# Altium project Ezlo_Voice_Assistant_Node.PrjPcb (part 1 of 2)
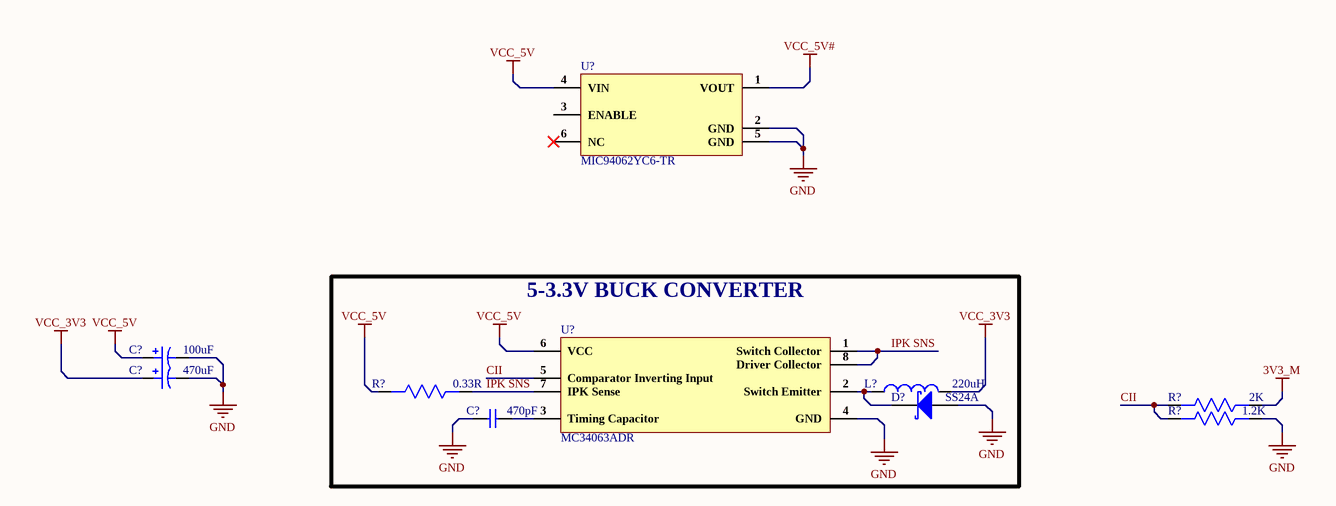
[diagram p0: Power_Section.SchDoc]
9 sheets, 98 parts. Net scope: flat (ports and power ports of the same name join across sheets).
Sheets:
  Top_Sheet.SchDoc
  Power_Section.SchDoc
  Controller_Section.SchDoc
  ADC_Section.SchDoc
  Memory_Section.SchDoc
  Mic_Section.SchDoc
  DAC_Section.SchDoc
  Amplifier_Section.SchDoc
  DSP_Section.SchDoc

## Sheet Top_Sheet.SchDoc
size A4; SheetNumber: 1; SheetTotal: 2

### Notes on the sheet
- 1
- Huzaifa Ali

## Sheet Power_Section.SchDoc
size A4; SheetNumber: 8; SheetTotal: 8

### Parts
(Parts that share a designator on the sheet are numbered #1, #2 ... from top to bottom, then left to right.)
C?#1  100uF  [VKMB1001E101MV]
C?#2  470uF  [VT1H471MI135000CE0]
C?#3  470pF  [Cap 0603]
D?#1  SS24A  [SMA]
L?#1  220uH  [SLF12575T-221M1R3-PF]
R?#1  0.33R  [Res0603]
R?#2  2K  [Res0603]
R?#3  1.2K  [Res0603]
U?#1  MIC94062YC6-TR  [SC-70-6]
U?#2  MC34063ADR  [SOIC-8]

### Blocks framed on the sheet
5-3.3V BUCK CONVERTER: C?#3 D?#1 L?#1 R?#1 U?#2

### Nets
3V3_M: R?#2.1
GND: C?#1.2 C?#2.2 C?#3.1 D?#1.2(A) R?#3.1 U?#1.2(GND) U?#1.5(GND) U?#2.4(GND)
VCC_3V3: C?#2.1 L?#1.2
VCC_5V: C?#1.1 R?#1.2 U?#1.4(VIN) U?#2.6(VCC)
VCC_5V#: U?#1.1(VOUT)
CII: R?#2.2 R?#3.2 U?#2.5(Comparator_Inverting_Input)
IPK SNS: R?#1.1 U?#2.1(Switch_Collector) U?#2.7(IPK_Sense) U?#2.8(Driver_Collector)
NetC?#3_2: C?#3.2 U?#2.3(Timing_Capacitor)
NetD?#1_1: D?#1.1(K) L?#1.1 U?#2.2(Switch_Emitter)

Not connected (* = marked no-connect by the designer): U?#1 3(ENABLE) 6(NC)*

### Notes on the sheet
- 1
- Huzaifa Ali

### Library data of the parts
C?#1 = VKMB1001E101MV: 25V 5mm 10mm 100uF 100kHz SMD,5x10mm Aluminum Electrolytic Cap- SMD ROHS; Manufacturer: Ymin; Manufacturer Part No: VKMB1001E101MV; Value: 100uF; Voltage: 25V; ComponentLink1Description: LCSC; ComponentLink1URL: https://lcsc.com/product-detail/Aluminum-Electrolytic-Capacitors-SMD_Ymin-VKMB1001E101MV_C487322.html
C?#2 = VT1H471MI135000CE0: 470uF ±20% 50V 12.5mm 13.5mm 1000hrs 105℃ -40℃~+105℃ SMD,12.5x13.5mm Aluminum Electrolytic Capacitors - SMD RoHS; Manufacturer: Changzhou Huawei Elec; Package: SMD,12.5x13.5mm; Capacitance: 470uF; Tolerance: ±20%; Rated Voltage: 50V; φD: 12.5mm; L: 13.5mm; Lifetime @ Temp: 1000hrs 105℃; Operating Temperature: -40℃~+105℃
C?#3 = CC0603KRX7R9BB471: CAP CER 470pF 10% X7R 50V 0603 SMD; Manufacturer: Yageo; Dielectric Material: Ceramic; Insulation Resistance: 10GR; Dissipation Factor: 2.5%; Supplier 1: Digi-Key; Manufacturer Part Number: CC0603KRX7R9BB471; RoHS: Yes; Category: Ceramic Capacitors; Stock 1: 2173; Pricing 1: 1=0.10000, 10=0.04500, 50=0.02460, 100=0.02010, 500=0.01432, 1000=0.01125 (USD); Mount: Surface Mount; Case/Package: 0603; Number of Pins: 2; Case Code (Imperial): 0603; Case Code (Metric): 1608; Min Operating Temperature: -55°C; Max Operating Temperature: 125°C; Capacitance: 470pF; Tolerance: 10%; Dielectric: X7R; Series: CC; Voltage Rating: 50V; Voltage Rating (DC): 50V; Packaging: Tape and Reel; Package Quantity: 1; Termination: SMD/SMT; Resistor Type: Ceramic; Length: 1.6mm; Width: 0.8mm; Height: 0.8mm; Depth: 0.8mm; Thickness: 0.035inch; Radiation Hardening: No; RoHS Compliant: Yes; REACH SVHC: No SVHC; Lead Free: Lead Free; Halogen Free: Halogen Free; ComponentLink1URL: https://datasheet.ciiva.com/5425/upy-gphc-x7r-6-3v-to-50v-8-12304-5425461.pdf?src-supplier=Mouser; ComponentLink1Description: https://datasheet.ciiva.com/5425/upy-gphc-x7r-6-3v-to-50v-8-12304-5425461.pdf?src-supplier=Mouser; ComponentLink2URL: https://datasheet.ciiva.com/144/mlccorderingcode-144439.pdf?src-supplier=Digi-Key; ComponentLink2Description: https://datasheet.ciiva.com/144/mlccorderingcode-144439.pdf?src-supplier=Digi-Key; ComponentLink3URL: https://datasheet.ciiva.com/144/mlccorderingcode-144440.pdf?src-supplier=Digi-Key; ComponentLink3Description: https://datasheet.ciiva.com/144/mlccorderingcode-144440.pdf?src-supplier=Digi-Key; ComponentLink4URL: https://datasheet.ciiva.com/11587/upy-gphc-x7r-6-3v-to-50v-8-11587224.pdf?src-supplier=Avnet; ComponentLink4Description: https://datasheet.ciiva.com/11587/upy-gphc-x7r-6-3v-to-50v-8-11587224.pdf?src-supplier=Avnet; ComponentLink5URL: https://datasheet.ciiva.com/144/mlccorderingcode-144441.pdf?src-supplier=Digi-Key; ComponentLink5Description: https://datasheet.ciiva.com/144/mlccorderingcode-144441.pdf?src-supplier=Digi-Key; ComponentLink6URL: https://datasheet.ciiva.com/16623/upy-gphc-x7r-6-3v-to-50v-8-16623897.pdf?src-supplier=Avnet+Europe; ComponentLink6Description: https://datasheet.ciiva.com/16623/upy-gphc-x7r-6-3v-to-50v-8-16623897.pdf?src-supplier=Avnet+Europe; ComponentLink7URL: https://datasheet.ciiva.com/8033/1489800-8033898.pdf?src-supplier=Element14; ComponentLink7Description: https://datasheet.ciiva.com/8033/1489800-8033898.pdf?src-supplier=Element14; ComponentLink8URL: https://datasheet.ciiva.com/8033/1489800-8033899.pdf?src-supplier=Element14; ComponentLink8Description: https://datasheet.ciiva.com/8033/1489800-8033899.pdf?src-supplier=Element14; ComponentLink9URL: https://datasheet.ciiva.com/26829/getdatasheetpartid-251791-26829452.pdf?src-supplier=Verical; ComponentLink9Description: https://datasheet.ciiva.com/26829/getdatasheetpartid-251791-26829452.pdf?src-supplier=Verical; ComponentLink10URL: https://datasheet.ciiva.com/28450/1489800-28450652.pdf?src-supplier=Element14; ComponentLink10Description: https://datasheet.ciiva.com/28450/1489800-28450652.pdf?src-supplier=Element14; ComponentLink11URL: https://datasheet.ciiva.com/8033/70765-8033902.pdf?src-supplier=Element14; ComponentLink11Description: https://datasheet.ciiva.com/8033/70765-8033902.pdf?src-supplier=Element14; Supplier Part Number 1: 311-1078-1-ND
D?#1 = SS24A: 40V 500mV@2A 2A SMA(DO-214AC) Schottky Barrier Diodes (SBD) ROHS; Manufacturer: Yangzhou; Manufacturer Part No: SS24A; Package: SMA(DO-214AC)
L?#1 = SLF12575T-221M1R3-PF: Inductor Power Shielded Wirewound 220uH 20% 1KHz Ferrite 1.3A 310mOhm DCR Blister T/R; Manufacturer: TDK; DC Resistance (DCR): 310mR; Supplier 1: Digi-Key; Manufacturer Part Number: SLF12575T-221M1R3-PF; RoHS: Yes; Category: Fixed Inductors; Stock 1: 1079; Pricing 1: 1=1.97000, 10=1.81500, 25=1.66360, 50=1.42180, 100=1.27050, 250=1.08900 (USD); Mount: Surface Mount; Case/Package: Nonstandard; Core Material: Ferrite; Min Operating Temperature: -20°C; Max Operating Temperature: 105°C; Package Quantity: 500; Packaging: Tape and Reel; Tolerance: 20%; Shielding: Shielded; Inductance: 220uH; Current Rating: 1.3A; Saturation Current: 1.3A; Max DC Current: 1.3A; Termination: SMD/SMT; Resistor Type: Wirewound; Test Frequency: 1kHz; DC Current: 1.3A; Series: SLF; Length: 12.5mm; Width: 12.5mm; Height: 0.295inch; Height - Seated (Max): 0.309inch; Depth: 12.8mm; Military Standard: Not; Lead Free: Lead Free; RoHS Compliant: Yes; ComponentLink1URL: https://datasheet.ciiva.com/11802/0900766b812b7d4f-11802208.pdf?src-supplier=RSComponents; ComponentLink1Description: https://datasheet.ciiva.com/11802/0900766b812b7d4f-11802208.pdf?src-supplier=RSComponents; Supplier Part Number 1: 445-174412-1-ND
R?#1 = RTT03R330FTP: ±1% 1/10W Thick Film Resistors 75V ±600ppm/℃ -55℃~+155℃ 0.33Ω 0603 Chip Resistor - Surface Mount ROHS; Manufacturer: RALEC; Manufacturer Part No: RTT03R330FTP; Value: 0.33Ω; Package: 0603
R?#2 = RC0603FR-072KL: RES SMD 2K OHM 1% 1/10W 0603; Manufacturer: Yageo; Resistance: 2kR; Temperature Coefficient: 100ppm/°C; Voltage Rating (DC): 50V; Power Rating: 100mW; Working Voltage: 75V; Supplier 1: Digi-Key; Manufacturer Part Number: RC0603FR-072KL; Stock 1: 8782961; Pricing 1: 1=0.1, 10=0.023, 100=0.0094, 1000=0.00421, 2500=0.00366 (USD); Case/Package: 0603; Number of Pins: 2; Case Code (Metric): 1608; Case Code (Imperial): 0603; Min Operating Temperature: -55°C; Max Operating Temperature: 155°C; Tolerance: 1%; Composition: Thick Film; Packaging: Tape and Reel; Voltage Rating: 50V; Package Quantity: 1; Number of Terminations: 2; Termination: SMD/SMT; Military Standard: Not; Max Power Dissipation: 100mW; Features: Moisture Resistant; Length: 1.6mm; Height: 0.45mm; Width: 0.031inch; Depth: 0.8mm; Lead Free: Lead Free; REACH SVHC: No SVHC; ComponentLink1URL: http://www.farnell.com/datasheets/2167052.pdf?src-supplier=Element14; ComponentLink1Description: http://www.farnell.com/datasheets/2167052.pdf?src-supplier=Element14; ComponentLink2URL: http://documents.rs-components.com/techlib://itc_doclist_GB.htm?stockno=5050139&src-supplier=RSComponents; ComponentLink2Description: http://documents.rs-components.com/techlib://itc_doclist_GB.htm?stockno=5050139&src-supplier=RSComponents; ComponentLink3URL: http://www.yageo.com/documents/recent/PYu-RC_Group_51_RoHS_L_10.pdf?src-supplier=Digi-Key; ComponentLink3Description: http://www.yageo.com/documents/recent/PYu-RC_Group_51_RoHS_L_10.pdf?src-supplier=Digi-Key; ComponentLink4URL: http://www.mouser.com/catalog/specsheets/RC0603.pdf?src-supplier=Mouser; ComponentLink4Description: http://www.mouser.com/catalog/specsheets/RC0603.pdf?src-supplier=Mouser; Supplier Part Number 1: 311-2.00KHRCT-ND
R?#3 = WR06X122JTL: RES 1.2K OHM 5% 1/10W 0603; Manufacturer: Walsin Technologies; Power Rating: 100mW; Voltage Rating (DC): 75V; Resistance: 1200R; Supplier 1: Arrow Electronics; Manufacturer Part Number: WR06X122JTL; RoHS: Yes; Category: Resistors; Stock 1: 545000; Pricing 1: 5000=0.00640, 10000=0.00630, 25000=0.00620, 50000=0.00610 (USD); Case/Package: Molded; Contact Material: Tin; Packaging: Tape and Reel; Tolerance: 5%; Lead Free: Lead Free; RoHS Compliant: Yes; ComponentLink1URL: http://www.farnell.com/datasheets/1960319.pdf?src-supplier=Farnell; ComponentLink1Description: http://www.farnell.com/datasheets/1960319.pdf?src-supplier=Farnell; ComponentLink2URL: https://www.verical.com/server-webapp/html/getDatasheet?partID=752938&src-supplier=Verical; ComponentLink2Description: https://www.verical.com/server-webapp/html/getDatasheet?partID=752938&src-supplier=Verical; Supplier Part Number 1: WR06X122 JTL
U?#1 = MIC94062YC6-TR: IC PWR SWITCH P-CHAN 1:1 SC70-6; Manufacturer: Microchip; Number of Outputs: 1; Output Current: 2A; Min Supply Voltage: 1.7V; Max Supply Voltage: 5.5V; Turn-Off Delay Time: 200ns; On-State Resistance: 77mR; Turn-On Delay Time: 1.5us; Interface: On/Off; Output Configuration: High Side; On-state Resistance-Max: 110MR; Supplier 1: Newark; Manufacturer Part Number: MIC94062YC6-TR; RoHS: Yes; Category: Hot Swap Controllers; Pricing 1: 1=0.67500, 3000=0.67500 (USD); Mount: Surface Mount; Case/Package: SC; Number of Pins: 6; Min Operating Temperature: -40°C; Max Operating Temperature: 125°C; Packaging: Tape and Reel; Nominal Supply Current: 2A; Package Quantity: 3000; Number of Inputs: 1; Max Output Current: 2A; Max Input Voltage: 5.5V; Min Input Voltage: 1.7V; Current Rating: 2A; Operating Supply Voltage: 5.5V; Number of Channels: 1; Supply Current: 2A; Series: -; Rated Current-Max: 2A; Length: 2.2mm; Width: 1.35mm; Height: 1mm; Radiation Hardening: No; REACH SVHC: No SVHC; Lead Free: Lead Free; RoHS Compliant: Yes; ComponentLink1URL: https://datasheet.ciiva.com/16217/mic94062-63-16217137.pdf?src-supplier=Future+Electronics; ComponentLink1Description: https://datasheet.ciiva.com/16217/mic94062-63-16217137.pdf?src-supplier=Future+Electronics; ComponentLink2URL: https://datasheet.ciiva.com/15108/getdatasheetpartid-57136-15108928.pdf?src-supplier=Verical; ComponentLink2Description: https://datasheet.ciiva.com/15108/getdatasheetpartid-57136-15108928.pdf?src-supplier=Verical; ComponentLink3URL: https://datasheet.ciiva.com/7642/250162-7642583.pdf?src-supplier=Element14; ComponentLink3Description: https://datasheet.ciiva.com/7642/250162-7642583.pdf?src-supplier=Element14; ComponentLink4URL: https://datasheet.ciiva.com/1955/mic94062-63-1955048.pdf?src-supplier=Digi-Key; ComponentLink4Description: https://datasheet.ciiva.com/1955/mic94062-63-1955048.pdf?src-supplier=Digi-Key; ComponentLink5URL: https://datasheet.ciiva.com/1955/mic94062-63-1955047.pdf?src-supplier=Digi-Key; ComponentLink5Description: https://datasheet.ciiva.com/1955/mic94062-63-1955047.pdf?src-supplier=Digi-Key; ComponentLink6URL: https://datasheet.ciiva.com/1955/mic94062-63-1955049.pdf?src-supplier=Digi-Key; ComponentLink6Description: https://datasheet.ciiva.com/1955/mic94062-63-1955049.pdf?src-supplier=Digi-Key; Supplier Part Number 1: 71Y3240
U?#2 = MC34063ADR: IC REG BUCK BST ADJ 1.5A 8SOIC; Manufacturer: Texas Instruments; Output Voltage: 40V; Number of Outputs: 1; Switching Frequency: 100kHz; Synchronous Rectifier: No; Output Type: Adjustable; Max Output Current: 750mA; Min Input Voltage: 3V; Min Output Voltage: 1.55V; Quiescent Current: 4mA; Topology: Flyback,SEPIC; Supplier 1: Digi-Key; Manufacturer Part Number: MC34063ADR; RoHS: Yes; Category: Power Supply Modules; Stock 1: 17204; Pricing 1: 1=0.78000, 10=0.68400, 25=0.64240, 100=0.52420, 250=0.48688, 500=0.41438, 1000=0.34206 (USD); Case/Package: D; Number of Pins: 8; Weight: 0.002561oz; Contact Plating: Gold; Min Operating Temperature: 0°C; Max Operating Temperature: 70°C; Output Current: 1.5A; Packaging: Tape and Reel; Package Quantity: 1; Max Input Voltage: 40V; Max Output Voltage: 40V; Termination: SMD/SMT; Radiation Hardening: No; RoHS Compliant: Yes; Lead Free: Lead Free; REACH SVHC: No SVHC; ComponentLink1URL: https://datasheet.ciiva.com/7408/1862376-7408060.pdf?src-supplier=Newark; ComponentLink1Description: https://datasheet.ciiva.com/7408/1862376-7408060.pdf?src-supplier=Newark; ComponentLink2URL: https://datasheet.ciiva.com/2025/mc33063a-2025162.pdf?src-supplier=Digi-Key; ComponentLink2Description: https://datasheet.ciiva.com/2025/mc33063a-2025162.pdf?src-supplier=Digi-Key; ComponentLink3URL: https://datasheet.ciiva.com/2025/mc33063a-2025161.pdf?src-supplier=Digi-Key; ComponentLink3Description: https://datasheet.ciiva.com/2025/mc33063a-2025161.pdf?src-supplier=Digi-Key; ComponentLink4URL: https://datasheet.ciiva.com/2025/mc33063a-2025163.pdf?src-supplier=Digi-Key; ComponentLink4Description: https://datasheet.ciiva.com/2025/mc33063a-2025163.pdf?src-supplier=Digi-Key; Supplier Part Number 1: 296-17765-1-ND

## Sheet Controller_Section.SchDoc
size A4; SheetNumber: 3; SheetTotal: 7
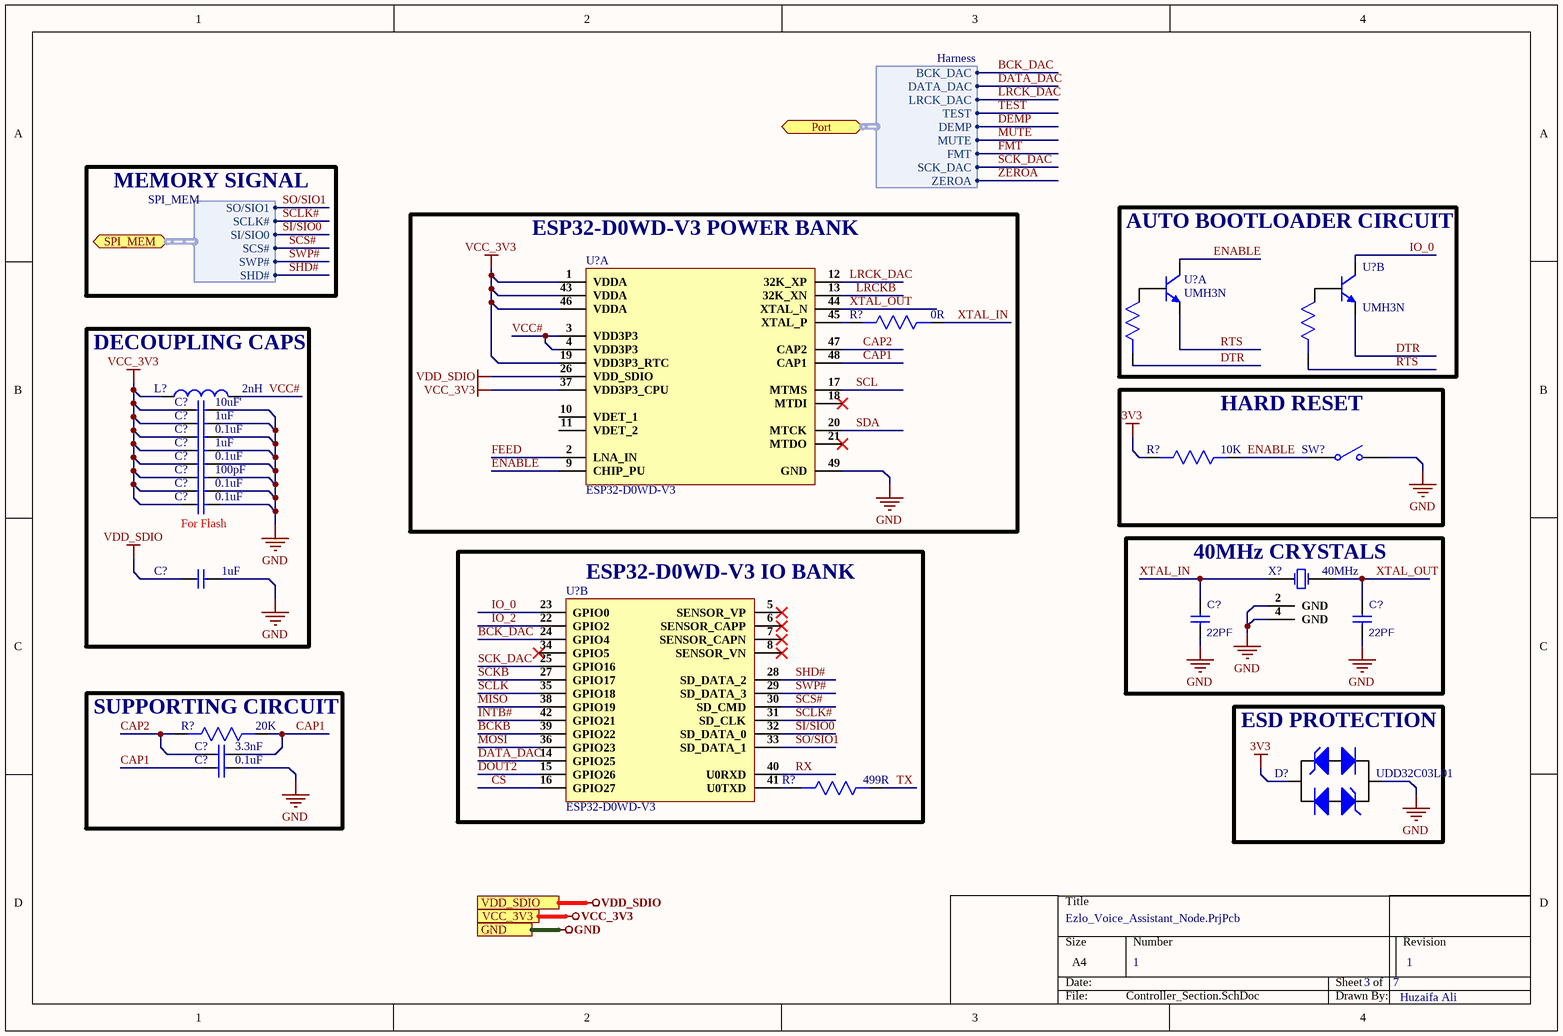
[diagram p1: Controller_Section.SchDoc]

### Parts
(Parts that share a designator on the sheet are numbered #1, #2 ... from top to bottom, then left to right.)
C?#4  10uF'  [Cap 0603]
C?#5  1uF  [Cap 0603]
C?#6  0.1uF  [Cap 0603]
C?#7  1uF  [Cap 0603]
C?#8  0.1uF  [Cap 0603]
C?#9  100pF  [Cap 0603]
C?#10  0.1uF  [Cap 0603]
C?#11  0.1uF  [Cap 0603]
C?#12  1uF  [Cap 0603]
C?#13  22PF  [Cap 0402]
C?#14  22PF  [Cap 0402]
C?#15  3.3nF  [Cap 0402]
C?#16  0.1uF  [Cap0603]
D?#2  UDD32C03L01  [UDD32C03L01]
L?#2  2nH  [IND 0603]
R?#4  0R  [Res0603]
R?#5  10K  [Res0603]
R?#6  20K  [Res0603]
R?#7  499R  [Res0603]
SW?  TS-1185EC-C-D-B  [TS-1185EC-C-D-B]  (value not drawn)
U?#3  UMH3N  [UMH3N]  (part B of 2)
U?#4  ESP32-D0WD-V3  [ESP32-D0WD-V3]  (part A of 2)
U?#5  UMH3N  [UMH3N]  (part A of 2)
U?#6  ESP32-D0WD-V3  [ESP32-D0WD-V3]  (part B of 2)
X?#1  40MHz  [X322540MPB4SI]

### Blocks framed on the sheet
ESP32-D0WD-V3 POWER BANK: R?#4 U?#4
AUTO BOOTLOADER CIRCUIT: U?#3 U?#5
DECOUPLING CAPS: C?#4-C?#12 L?#2
HARD RESET: R?#5 SW?
ESP32-D0WD-V3 IO BANK: R?#7 U?#6
40MHz CRYSTALS: C?#13 C?#14 X?#1
SUPPORTING CIRCUIT: C?#15 C?#16 R?#6
ESD PROTECTION: D?#2

### Ports
GND, Port (bidir, harness Harness), SPI_MEM (bidir, harness SPI_MEM), VCC_3V3, VDD_SDIO

### Harnesses
SPI_MEM: SO/SIO1, SCLK#, SI/SIO0, SCS#, SWP#, SHD#
Harness: BCK_DAC, DATA_DAC, LRCK_DAC, TEST, DEMP, MUTE, FMT, SCK_DAC, ZEROA

### Nets
3V3: D?#2.1 R?#5.2
GND: C?#4.2 C?#5.2 C?#6.2 C?#7.2 C?#8.2 C?#9.2 C?#10.2 C?#11.2 C?#12.2 C?#13.1 C?#14.1 C?#16.2 D?#2.2 SW?.2 U?#4.49(GND) X?#1.2(GND) X?#1.4(GND) ; port GND
VCC_3V3: C?#4.1 C?#5.1 C?#6.1 C?#7.1 C?#8.1 C?#9.1 C?#10.1 C?#11.1 L?#2.1 U?#4.1(VDDA) U?#4.19(VDD3P3_RTC) U?#4.37(VDD3P3_CPU) U?#4.43(VDDA) U?#4.46(VDDA) ; port VCC_3V3
VDD_SDIO: C?#12.1 U?#4.26(VDD_SDIO) ; port VDD_SDIO
~{C}S: U?#6.16(GPIO27)
BCK_DAC: U?#6.24(GPIO4) ; port Port.BCK_DAC
BCKB: U?#6.39(GPIO22)
CAP1: C?#15.2 C?#16.1 R?#6.1 U?#4.48(CAP1)
CAP2: C?#15.1 R?#6.2 U?#4.47(CAP2)
DATA_DAC: U?#6.14(GPIO25) ; port Port.DATA_DAC
DOUT2: U?#6.15(GPIO26)
DTR: U?#3.4(E) U?#5.2
ENABLE: R?#5.1 SW?.1 U?#4.9(CHIP_PU) U?#5.6(C)
FEED: U?#4.2(LNA_IN)
INTB#: U?#6.42(GPIO21)
IO_0: U?#3.3(C) U?#6.23(GPIO0)
IO_2: U?#6.22(GPIO2)
LRCK_DAC: U?#4.12(32K_XP) ; port Port.LRCK_DAC
LRCKB: U?#4.13(32K_XN)
MISO: U?#6.38(GPIO19)
MOSI: U?#6.36(GPIO23)
RTS: U?#3.5 U?#5.1(E)
RX: U?#6.40(U0RXD)
SCK_DAC: U?#6.25(GPIO16) ; port Port.SCK_DAC
SCKB: U?#6.27(GPIO17)
SCL: U?#4.17(MTMS)
SCLK: U?#6.35(GPIO18)
SCLK#: U?#6.31(SD_CLK) ; port SPI_MEM.SCLK#
SCS#: U?#6.30(SD_CMD) ; port SPI_MEM.SCS#
SDA: U?#4.20(MTCK)
SHD#: U?#6.28(SD_DATA_2) ; port SPI_MEM.SHD#
SI/SIO0: U?#6.32(SD_DATA_0) ; port SPI_MEM.SI/SIO0
SO/SIO1: U?#6.33(SD_DATA_1) ; port SPI_MEM.SO/SIO1
SWP#: U?#6.29(SD_DATA_3) ; port SPI_MEM.SWP#
TX: R?#7.1
VCC#: L?#2.2 U?#4.3(VDD3P3) U?#4.4(VDD3P3)
XTAL_IN: C?#13.2 R?#4.1 X?#1.1(CRYSTAL)
XTAL_OUT: C?#14.2 U?#4.44(XTAL_N) X?#1.3(CRYSTAL)
NetR?#4_2: R?#4.2 U?#4.45(XTAL_P)
NetR?#7_2: R?#7.2 U?#6.41(U0TXD)

Not connected (* = marked no-connect by the designer): U?#4 10(VDET_1) 11(VDET_2) 18(MTDI)* 21(MTDO)*; U?#6 5(SENSOR_VP)* 6(SENSOR_CAPP)* 7(SENSOR_CAPN)* 8(SENSOR_VN)* 34(GPIO5)*

### Notes on the sheet
- MEMORY SIGNAL
- (near C?#11) For Flash
- 1
- Huzaifa Ali

### Library data of the parts
C?#4 = CL10A106MA8NRNC: CAP CER 10UF 25V X5R 0603; Manufacturer: Samsung; Tolerance: 20%; Supplier 1: Avnet; Manufacturer Part Number: CL10A106MA8NRNC; RoHS: Yes; Category: Ceramic Capacitors; Pricing 1: 4000=0.03753, 8000=0.03700, 16000=0.03595, 24000=0.03515, 32000=0.03383, 40000=0.03304, 400000=0.03225 (USD); Mount: Surface Mount; Case/Package: 0603; Case Code (Metric): 1608; Case Code (Imperial): 0603; Contact Plating: Tin; Min Operating Temperature: -55°C; Max Operating Temperature: 85°C; Package Quantity: 1; Packaging: Tape and Reel; Capacitance: 10uF; Voltage Rating: 25V; Dielectric: X5R; Termination: Wraparound; Series: CL; Construction: Flat; Length: 0.063inch; Width: 0.031inch; Thickness: 0.035inch; Lead Free: Lead Free; RoHS Compliant: Yes; ComponentLink1URL: https://datasheet.ciiva.com/25766/cl10a106ma8nrnc-25766562.pdf?src-supplier=Digi-Key; ComponentLink1Description: https://datasheet.ciiva.com/25766/cl10a106ma8nrnc-25766562.pdf?src-supplier=Digi-Key; Supplier Part Number 1: CL10A106MA8NRNC
C?#5 C?#7 C?#12 = CC0603KRX5R8BB105: CAP CER 1UF 25V X5R 0603; Manufacturer: Yageo; Tolerance: 10%; Supplier 1: Digi-Key; Manufacturer Part Number: CC0603KRX5R8BB105; RoHS: Yes; Category: Ceramic Capacitors; Stock 1: 919939; Pricing 1: 1=0.12000, 10=0.08400, 50=0.04760, 100=0.03940, 500=0.02764, 1000=0.02288 (USD); Mount: Surface Mount; Case/Package: 0603; Number of Pins: 2; Case Code (Metric): 1608; Case Code (Imperial): 0603; Min Operating Temperature: -55°C; Max Operating Temperature: 85°C; Capacitance: 1uF; Dielectric: X5R; Package Quantity: 1; Voltage Rating: 25V; Packaging: Tape and Reel; Termination: SMD/SMT; Voltage Rating (DC): 25V; Series: CC; Construction: Flat; Length: 1.6mm; Width: 0.031inch; Height: 0.8mm; Thickness: 0.035inch; Depth: 0.8mm; Radiation Hardening: No; REACH SVHC: No SVHC; Lead Free: Lead Free; Halogen Free: Halogen Free; RoHS Compliant: Yes; ComponentLink1URL: https://datasheet.ciiva.com/176/mlccorderingcode-176785.pdf?src-supplier=Digi-Key; ComponentLink1Description: https://datasheet.ciiva.com/176/mlccorderingcode-176785.pdf?src-supplier=Digi-Key; ComponentLink2URL: https://datasheet.ciiva.com/176/mlccorderingcode-176786.pdf?src-supplier=Digi-Key; ComponentLink2Description: https://datasheet.ciiva.com/176/mlccorderingcode-176786.pdf?src-supplier=Digi-Key; ComponentLink3URL: https://datasheet.ciiva.com/176/mlccorderingcode-176787.pdf?src-supplier=Digi-Key; ComponentLink3Description: https://datasheet.ciiva.com/176/mlccorderingcode-176787.pdf?src-supplier=Digi-Key; ComponentLink4URL: https://datasheet.ciiva.com/17436/upy-gphc-x5r-4v-to-50v-12-17436952.pdf?src-supplier=Avnet+Europe; ComponentLink4Description: https://datasheet.ciiva.com/17436/upy-gphc-x5r-4v-to-50v-12-17436952.pdf?src-supplier=Avnet+Europe; ComponentLink5URL: https://datasheet.ciiva.com/7978/1525783-7978171.pdf?src-supplier=Element14; ComponentLink5Description: https://datasheet.ciiva.com/7978/1525783-7978171.pdf?src-supplier=Element14; ComponentLink6URL: https://datasheet.ciiva.com/11586/upy-gphc-x5r-4v-to-50v-12-11586318.pdf?src-supplier=Avnet; ComponentLink6Description: https://datasheet.ciiva.com/11586/upy-gphc-x5r-4v-to-50v-12-11586318.pdf?src-supplier=Avnet; Supplier Part Number 1: 311-1445-1-ND
C?#6 C?#8 C?#10 C?#11 = CC0603KRX7R0BB104: CAP CER 0.1UF 100V X7R 0603; Manufacturer: Yageo; Capacitance: 100nF; Tolerance: 10%; Supplier 1: Digi-Key; Manufacturer Part Number: CC0603KRX7R0BB104; RoHS: Yes; Category: Ceramic Capacitors; Stock 1: 60476; Pricing 1: 1=0.19000, 10=0.13500, 50=0.07680, 100=0.06370, 500=0.04466, 1000=0.03696 (USD); Mount: Surface Mount; Case/Package: 0603; Case Code (Metric): 1608; Case Code (Imperial): 0603; Weight: 7.1E-05oz; Min Operating Temperature: -55°C; Max Operating Temperature: 125°C; Package Quantity: 4000; Voltage Rating: 100V; Packaging: Tape and Reel; Dielectric: X7R; Termination: SMD/SMT; Resistor Type: Ceramic; Voltage Rating (DC): 100V; Series: CC; Length: 0.063inch; Width: 0.031inch; Thickness: 0.035inch; Depth: 0.8mm; Lead Free: Lead Free; RoHS Compliant: Yes; ComponentLink1URL: https://datasheet.ciiva.com/6277/mlccorderingcode-6277030.pdf?src-supplier=Digi-Key; ComponentLink1Description: https://datasheet.ciiva.com/6277/mlccorderingcode-6277030.pdf?src-supplier=Digi-Key; ComponentLink2URL: https://datasheet.ciiva.com/6277/mlccorderingcode-6277081.pdf?src-supplier=Digi-Key; ComponentLink2Description: https://datasheet.ciiva.com/6277/mlccorderingcode-6277081.pdf?src-supplier=Digi-Key; ComponentLink3URL: https://datasheet.ciiva.com/6277/mlccorderingcode-6277082.pdf?src-supplier=Digi-Key; ComponentLink3Description: https://datasheet.ciiva.com/6277/mlccorderingcode-6277082.pdf?src-supplier=Digi-Key; Supplier Part Number 1: 311-1523-1-ND
C?#9 = CC0603KRX7R8BB101: CAP CER 100PF 25V X7R 0603; Manufacturer: Yageo; Tolerance: 10%; Supplier 1: Avnet; Manufacturer Part Number: CC0603KRX7R8BB101; RoHS: Yes; Category: Ceramic Capacitors; Stock 1: 12000; Pricing 1: 4000=0.00493, 8000=0.00479, 16000=0.00466, 24000=0.00452, 32000=0.00439 (USD); Mount: Surface Mount; Case/Package: 0603; Case Code (Imperial): 0603; Case Code (Metric): 1608; Weight: 7.1E-05oz; Min Operating Temperature: -55°C; Max Operating Temperature: 125°C; Packaging: Tape and Reel; Capacitance: 100pF; Voltage Rating (DC): 25V; Dielectric: X7R; Voltage Rating: 25V; Termination: SMD/SMT; Resistor Type: Ceramic; Series: CC; Length: 0.063inch; Width: 0.031inch; Thickness: 0.035inch; Depth: 0.8mm; Lead Free: Lead Free; Halogen Free: Halogen Free; RoHS Compliant: Yes; ComponentLink1URL: https://datasheet.ciiva.com/13265/upy-gphc-x7r-6-3v-to-50v-8-12304-13265007.pdf?src-supplier=Mouser; ComponentLink1Description: https://datasheet.ciiva.com/13265/upy-gphc-x7r-6-3v-to-50v-8-12304-13265007.pdf?src-supplier=Mouser; Supplier Part Number 1: CC0603KRX7R8BB101
C?#13 C?#14 = 04025A220FAT2A: CAP CER 22PF 50V C0G/NP0 0402; Manufacturer: Kyocera AVX; Tolerance: 1%; Dielectric: C0G; ComponentLink1URL: http://psearch.murata.com/capacitor/product/GCM219R71C105KA37%23.pdf; ComponentLink1Description: http://psearch.murata.com/capacitor/product/GCM219R71C105KA37%23.pdf; ComponentLink2URL: http://search.murata.co.jp/Ceramy/image/img/A01X/partnumbering_e_02.pdf; ComponentLink2Description: http://search.murata.co.jp/Ceramy/image/img/A01X/partnumbering_e_02.pdf; ComponentLink3URL: http://psearch.en.murata.com/capacitor/product/GCM219R71C105KA37%23.pdf; ComponentLink3Description: http://psearch.en.murata.com/capacitor/product/GCM219R71C105KA37%23.pdf; ComponentLink4URL: http://uk.rs-online.com/webdocs/0ef9/0900766b80ef92d0.pdf; ComponentLink4Description: http://uk.rs-online.com/webdocs/0ef9/0900766b80ef92d0.pdf; ComponentLink5URL: http://www.yageo.com/documents/recent/UPY-GP_NP0_16V-to-50V_16.pdf; ComponentLink5Description: http://www.yageo.com/documents/recent/UPY-GP_NP0_16V-to-50V_16.pdf; ComponentLink6URL: http://www.farnell.com/datasheets/1443161.pdf; ComponentLink6Description: http://www.farnell.com/datasheets/1443161.pdf; ComponentLink7URL: http://www.yageo.com/documents/recent/UPY-GP_NP0_16V-to-50V_8.pdf; ComponentLink7Description: http://www.yageo.com/documents/recent/UPY-GP_NP0_16V-to-50V_8.pdf; ComponentLink8URL: http://www.farnell.com/datasheets/1132289.pdf; ComponentLink8Description: http://www.farnell.com/datasheets/1132289.pdf; ComponentLink9URL: http://www.mouser.com/ds/2/447/Yageo_UPY-GP_NP0_16V-to-50V_9-358835.pdf; ComponentLink9Description: http://www.mouser.com/ds/2/447/Yageo_UPY-GP_NP0_16V-to-50V_9-358835.pdf; ComponentLink10URL: https://www.verical.com/server-webapp/html/getDatasheet?partID=370074; ComponentLink10Description: https://www.verical.com/server-webapp/html/getDatasheet?partID=370074; ComponentLink11URL: http://catalogs.avx.com/SurfaceMount.pdf; ComponentLink11Description: http://catalogs.avx.com/SurfaceMount.pdf; ComponentLink12URL: http://www.avxcorp.com/docs/Catalogs/ccog.pdf; ComponentLink12Description: http://www.avxcorp.com/docs/Catalogs/ccog.pdf; ComponentLink13URL: http://www.mouser.com/ds/2/40/C0GNP0-Dielectric-951274.pdf; ComponentLink13Description: http://www.mouser.com/ds/2/40/C0GNP0-Dielectric-951274.pdf; Supplier 1: Digi-Key; Manufacturer Part Number: 04025A220FAT2A; Stock 1: 100000; Pricing 1: 1=0.67, 10=0.472, 100=0.3105, 500=0.23, 1000=0.1955, 2500=0.184, 5000=0.1725 (USD); Mount: Surface Mount; Case/Package: 0402; Case Code (Metric): 1005; Case Code (Imperial): 0402; Contact Plating: Matte,Tin; Min Operating Temperature: -55°C; Max Operating Temperature: 125°C; Capacitance: 22pF; Packaging: Tape and Reel; Voltage Rating (DC): 50V; Voltage Rating: 50V; Package Quantity: 1; Termination: SMD/SMT; Length: 1mm; Height: 0.56mm; Depth: 0.5mm; Width: 0.02inch; Thickness: 0.022inch; Radiation Hardening: No; REACH SVHC: Unknown; Lead Free: Lead Free; Supplier Part Number 1: 478-5765-1-ND
C?#15 = CGA2B2X7R1H332M050BA: CAP CER 3300PF 50V X7R 0402; Manufacturer: TDK; Tolerance: 20%; Supplier 1: Digi-Key; Manufacturer Part Number: CGA2B2X7R1H332M050BA; RoHS: Yes; Category: Ceramic Capacitors; Stock 1: 30365; Pricing 1: 1=0.10000, 10=0.05400, 50=0.02960, 100=0.02430, 500=0.01732, 1000=0.01361, 2500=0.01238, 5000=0.01138 (USD); Mount: Surface Mount; Case/Package: 0402; Case Code (Metric): 1005; Case Code (Imperial): 0402; Min Operating Temperature: -55°C; Max Operating Temperature: 125°C; Package Quantity: 10000; Packaging: Tape and Reel; Capacitance: 3.3nF; Voltage Rating: 50V; Series: CGA; Length: 0.039inch; Width: 0.02inch; Thickness: 0.022inch; Ratings: AEC-Q200; RoHS Compliant: Yes; ComponentLink1URL: https://product.tdk.com/info/en/documents/chara_sheet/CGA2B2X7R1H332M050BA.pdf?src-supplier=Digi-Key; ComponentLink1Description: https://product.tdk.com/info/en/documents/chara_sheet/CGA2B2X7R1H332M050BA.pdf?src-supplier=Digi-Key; ComponentLink2URL: https://product.tdk.com/info/en/catalog/datasheets/mlcc_automotive_general_en.pdf?src-supplier=Digi-Key; ComponentLink2Description: https://product.tdk.com/info/en/catalog/datasheets/mlcc_automotive_general_en.pdf?src-supplier=Digi-Key; ComponentLink3URL: http://product.tdk.com/en/catalog/datasheets/mlcc_automotive_general_en.pdf?src-supplier=Avnet; ComponentLink3Description: http://product.tdk.com/en/catalog/datasheets/mlcc_automotive_general_en.pdf?src-supplier=Avnet; Supplier Part Number 1: 445-12276-1-ND
C?#16 = CC0603ZRY5V9BB104: CAP CER 0.1UF 50V Y5V 0603; Manufacturer: Yageo; Capacitance: 100nF; Tolerance: 80%; Supplier 1: Digi-Key; Manufacturer Part Number: CC0603ZRY5V9BB104; Stock 1: 15000880; Pricing 1: 1=0.1, 10=0.075, 100=0.0334, 500=0.02386, 1000=0.01874 (USD); Mount: Surface Mount; Case/Package: 0603; Number of Pins: 2; Case Code (Metric): 1608; Case Code (Imperial): 0603; Min Operating Temperature: -30°C; Max Operating Temperature: 85°C; Dielectric: Y5V; Voltage Rating: 50V; Package Quantity: 1; Packaging: Tape and Reel; Voltage Rating (DC): 50V; Termination: SMD/SMT; Composition: Ceramic; Voltage: 50V; Length: 1.6mm; Height: 0.8mm; Width: 0.031inch; Thickness: 0.035inch; Depth: 0.8mm; Radiation Hardening: No; REACH SVHC: No SVHC; Lead Free: Lead Free; Halogen Free: Halogen Free; ComponentLink1URL: http://www.yageo.com/documents/recent/UPY-GPHC_Y5V_6.3V-to-50V_8.pdf?src-supplier=Digi-Key; ComponentLink1Description: http://www.yageo.com/documents/recent/UPY-GPHC_Y5V_6.3V-to-50V_8.pdf?src-supplier=Digi-Key; ComponentLink2URL: http://www.yageo.com/documents/recent/UPY-GPHC_Y5V_6.3V-to-50V_5.pdf?src-supplier=Avnet+Europe; ComponentLink2Description: http://www.yageo.com/documents/recent/UPY-GPHC_Y5V_6.3V-to-50V_5.pdf?src-supplier=Avnet+Europe; ComponentLink3URL: https://www.verical.com/server-webapp/html/getDatasheet?partID=403611&src-supplier=Verical; ComponentLink3Description: https://www.verical.com/server-webapp/html/getDatasheet?partID=403611&src-supplier=Verical; ComponentLink4URL: http://www.mouser.com/ds/2/447/Yageo_UPY-GP_NP0_16V-to-50V_9-358835.pdf?src-supplier=Mouser; ComponentLink4Description: http://www.mouser.com/ds/2/447/Yageo_UPY-GP_NP0_16V-to-50V_9-358835.pdf?src-supplier=Mouser; ComponentLink5URL: http://www.farnell.com/datasheets/1132289.pdf?src-supplier=Element14; ComponentLink5Description: http://www.farnell.com/datasheets/1132289.pdf?src-supplier=Element14; Supplier Part Number 1: 311-1343-1-ND
D?#2 = UDD32C03L01: 15V 19A 3.3V 4V Bidirectional SOD-323 ESD Protection Devices ROHS; Manufacturer: Brightking; Manufacturer Part Number: UDD32C03L01; Footprint: SOD-323; ComponentLink1Description: LCSC; ComponentLink1URL: https://lcsc.com/product-detail/span-style-background-color-ff0-ESD-span-Protection-Devices_Brightking-Elec-TAIWAN-UDD32C03L01_C78439.html
L?#2 = SDCL1608C2N0STDF: 2nH ±0.3nH 0603 Inductors; Manufacturer: Sunlord; Rated Current: 300mA; Inductance: 2nH; Package Case: 0603
R?#4 = RC0603FR-070RL: RES SMD 0R, 1%, 0.1W, 0603; Manufacturer: Yageo; Resistance: 0mR; Power Rating: 100mW; Voltage Rating (DC): 50V; Temperature Coefficient: 200ppm/°C; Current Rating: 1A; Working Voltage: 75V; Supplier 1: Arrow Electronics; Manufacturer Part Number: RC0603FR-070RL; RoHS: Yes; Category: Chip SMD Resistors; Stock 1: 1270000; Pricing 1: 5000=0.00320, 5000=0.00490, 50000=0.00450, 500000=0.00250, 2500000=0.00150 (USD); Case/Package: 0603; Number of Pins: 2; Contact Plating: Tin,Matte; Case Code (Metric): 1608; Case Code (Imperial): 0603; Min Operating Temperature: -55°C; Max Operating Temperature: 155°C; Resistor Type: Thick Film; Packaging: Tape and Reel; Tolerance: 1%; Package Quantity: 5000; Voltage Rating: 50V; Number of Terminations: 2; Termination: SMD/SMT; Max Power Dissipation: 100mW; Features: Moisture Resistant; Length: 1.6mm; Width: 0.031inch; Height: 0.45mm; Depth: 0.8mm; Radiation Hardening: No; REACH SVHC: No SVHC; Lead Free: Lead Free; Military Standard: Not; ComponentLink1URL: https://datasheet.ciiva.com/11808/0900766b80f96399-11808172.pdf?src-supplier=RSComponents; ComponentLink1Description: https://datasheet.ciiva.com/11808/0900766b80f96399-11808172.pdf?src-supplier=RSComponents; ComponentLink2URL: https://datasheet.ciiva.com/5558/rc0603-272842-5558341.pdf?src-supplier=Mouser; ComponentLink2Description: https://datasheet.ciiva.com/5558/rc0603-272842-5558341.pdf?src-supplier=Mouser; ComponentLink3URL: https://datasheet.ciiva.com/46382/443971-46382072.pdf?src-supplier=Element14; ComponentLink3Description: https://datasheet.ciiva.com/46382/443971-46382072.pdf?src-supplier=Element14; ComponentLink4URL: https://datasheet.ciiva.com/29721/pyu-r-int-thick-7-29721178.pdf?src-supplier=Digi-Key; ComponentLink4Description: https://datasheet.ciiva.com/29721/pyu-r-int-thick-7-29721178.pdf?src-supplier=Digi-Key; ComponentLink5URL: https://datasheet.ciiva.com/5684/443971-5684699.pdf?src-supplier=Farnell; ComponentLink5Description: https://datasheet.ciiva.com/5684/443971-5684699.pdf?src-supplier=Farnell; ComponentLink6URL: https://datasheet.ciiva.com/7983/443971-7983627.pdf?src-supplier=Element14; ComponentLink6Description: https://datasheet.ciiva.com/7983/443971-7983627.pdf?src-supplier=Element14; ComponentLink7URL: https://datasheet.ciiva.com/29721/pyu-rc0603-51-rohs-l-4-29721179.pdf?src-supplier=Digi-Key; ComponentLink7Description: https://datasheet.ciiva.com/29721/pyu-rc0603-51-rohs-l-4-29721179.pdf?src-supplier=Digi-Key; ComponentLink8URL: https://datasheet.ciiva.com/22643/1868787-22643388.pdf?src-supplier=Element14; ComponentLink8Description: https://datasheet.ciiva.com/22643/1868787-22643388.pdf?src-supplier=Element14; Supplier Part Number 1: RC0603FR-070RL
R?#5 = AC0603JR-0710KL: RES SMD 10K OHM 5% 1/10W 0603; Manufacturer: Yageo; Voltage Rating: 50V; Resistance: 10kR; Power Rating: 100mW; Temperature Coefficient: 100ppm/°C; Supplier 1: Future Electronics; Manufacturer Part Number: AC0603JR-0710KL; RoHS: Yes; Category: Chip SMD Resistors; Stock 1: 1533000; Pricing 1: 5000=0.00540 (USD); Case/Package: 0603; Case Code (Imperial): 0603; Case Code (Metric): 1608; Size Code: 0603; Min Operating Temperature: -55°C; Max Operating Temperature: 155°C; Packaging: Tape and Reel; Tolerance: 5%; Package Quantity: 1; Resistor Type: Thick Film; Termination: SMD/SMT; Number of Terminations: 2; Max Power Dissipation: 100mW; Features: Moisture Resistant,Automotive AEC-Q200,Anti-Sulfur; Series: AC; Construction: Rectangular; Length: 0.063inch; Width: 0.031inch; Height: 0.022inch; Depth: 0.8mm; Military Standard: Not; Lead Free: Lead Free; RoHS Compliant: Yes; ComponentLink1URL: https://datasheet.ciiva.com/5562/pyu-ac-51-rohs-l-2-5562553.pdf?src-supplier=Mouser; ComponentLink1Description: https://datasheet.ciiva.com/5562/pyu-ac-51-rohs-l-2-5562553.pdf?src-supplier=Mouser; Supplier Part Number 1: 1029044
R?#6 = RC0603FR-0720KL: RES SMD 20K OHM 1% 1/10W 0603
R?#7 = RC0603FR-07499RL: RES SMD 499Ω ± 1.00% 0.1W ± 100ppm/℃ 0603; Manufacturer: Yageo; Tolerance: 1%; Temperature Coefficient: 100ppm/°C; Power Rating: 100mW; Voltage Rating: 50V; Supplier 1: RSComponents; Manufacturer Part Number: RC0603FR-07499RL; RoHS: Yes; Category: Chip SMD Resistors; Stock 1: 900; Pricing 1: 5000=0.00300, 10000=0.00300, 15000=0.00300, 20000=0.00200 (GBP); Mount: Surface Mount; Case/Package: 0603; Contact Plating: Tin,Matte; Case Code (Metric): 1608; Case Code (Imperial): 0603; Size Code: 0603; Min Operating Temperature: -55°C; Max Operating Temperature: 155°C; Resistance: 499R; Resistor Type: Thick Film; Package Quantity: 1; Packaging: Tape and Reel; Number of Terminations: 2; Termination: SMD/SMT; Max Power Dissipation: 100mW; Voltage Rating (DC): 50V; Features: Moisture Resistant; Series: RC; Construction: Rectangular; Technology: THICK FILM; Length: 1.6mm; Width: 0.031inch; Height: 0.45mm; Depth: 0.8mm; Radiation Hardening: No; Military Standard: Not; Lead Free: Lead Free; RoHS Compliant: Yes; ComponentLink1URL: https://datasheet.ciiva.com/11808/0900766b80f96399-11808558.pdf?src-supplier=RSComponents; ComponentLink1Description: https://datasheet.ciiva.com/11808/0900766b80f96399-11808558.pdf?src-supplier=RSComponents; ComponentLink2URL: https://datasheet.ciiva.com/2453/pyu-r-int-thick-7-2453956.pdf?src-supplier=Digi-Key; ComponentLink2Description: https://datasheet.ciiva.com/2453/pyu-r-int-thick-7-2453956.pdf?src-supplier=Digi-Key; ComponentLink3URL: https://datasheet.ciiva.com/2453/pyu-r-int-thick-7-2453957.pdf?src-supplier=Digi-Key; ComponentLink3Description: https://datasheet.ciiva.com/2453/pyu-r-int-thick-7-2453957.pdf?src-supplier=Digi-Key; ComponentLink4URL: https://datasheet.ciiva.com/2453/pyu-r-int-thick-7-2453955.pdf?src-supplier=Digi-Key; ComponentLink4Description: https://datasheet.ciiva.com/2453/pyu-r-int-thick-7-2453955.pdf?src-supplier=Digi-Key; ComponentLink5URL: https://datasheet.ciiva.com/12558/rc0603-272842-12558391.pdf?src-supplier=Mouser; ComponentLink5Description: https://datasheet.ciiva.com/12558/rc0603-272842-12558391.pdf?src-supplier=Mouser; ComponentLink6URL: https://datasheet.ciiva.com/8885/pyu-rc0603-51-rohs-l-4-8885483.pdf?src-supplier=Avnet; ComponentLink6Description: https://datasheet.ciiva.com/8885/pyu-rc0603-51-rohs-l-4-8885483.pdf?src-supplier=Avnet; Supplier Part Number 1: 1995585
SW? = TS-1185EC-C-D-B: 3mm 2mm Round Button 50mA Top3.65mm SPST 12V SMD Tactile Switches; Manufacturer: XKB; Manufacturer Part Number: TS-1185EC-C-D-B; Footprint: Custom; ComponentLink1Description: LCSC; ComponentLink1URL: https://lcsc.com/product-detail/Tactile-Switches_XKB-Connectivity-TS-1185EC-C-D-B_C318893.html
U?#3 U?#5 = UMH3N: 2 NPN pre-biased (Dual) 150mW 100mA 50V SC-70-6(SOT-363) Digital Transistors ROHS; Manufacturer: Changjiang; Manufacturer Part Number: UMH3N; Footprint: SC-70-6(SOT-363); ComponentLink1Description: LCSC; ComponentLink1URL: https://www.lcsc.com/product-detail/Digital-Transistors_Changjiang-Electronics-Tech-CJ-UMH3N_C62892.html
U?#4 U?#6 = ESP32-D0WD-V3: IC RF TXRX+MCU BLUETOOTH WIFI; Manufacturer: Espressif Systems; Supplier 1: Digi-Key; Manufacturer Part Number: ESP32-D0WD-V3; RoHS: No; Category: RF Receivers, Transceivers; Stock 1: 29666; Pricing 1: 1=1.80000 (USD); Supplier Part Number 1: 1904-ESP32-D0WD-V3CT-ND
X?#1 = X322540MPB4SI: 40MHz SMD Crystal Resonator 15pF ±10ppm ±30ppm -40℃~+85℃ SMD3225-4P Crystals ROHS; Manufacturer: Yangxing Tech; Manufacturer Part Number: X322540MPB4SI; Value: 40MHZ